# Altium schematic sheet P1.schdoc
size 594 x 419 mm; Device: Drawing-Symbol_A4; @Board Name: Board1_1; @Page Name: P1; @Create Time: 00:50:03; @Page Count: 1; @Page No: 1; @Schematic Name: Schematic1_1; @Update Time: 00:50:03; @Assembly Variant: Basic; Border: 1; Title Block Position: 3; Size: A4; Region Start: 1; X Region Count: 6; Y Region Count: 4; Blade Width: 10; Width: 2338; Height: 1652; Symbol: Drawing-Symbol_A4; Company: 嘉立创EDA; Version: V1.0; Page Size: A4; @Project Name: 基于F1C200S的Linux无线调试与AI协作网关; @Update Date: 2026-11-21; @Create Date: 2026-11-21
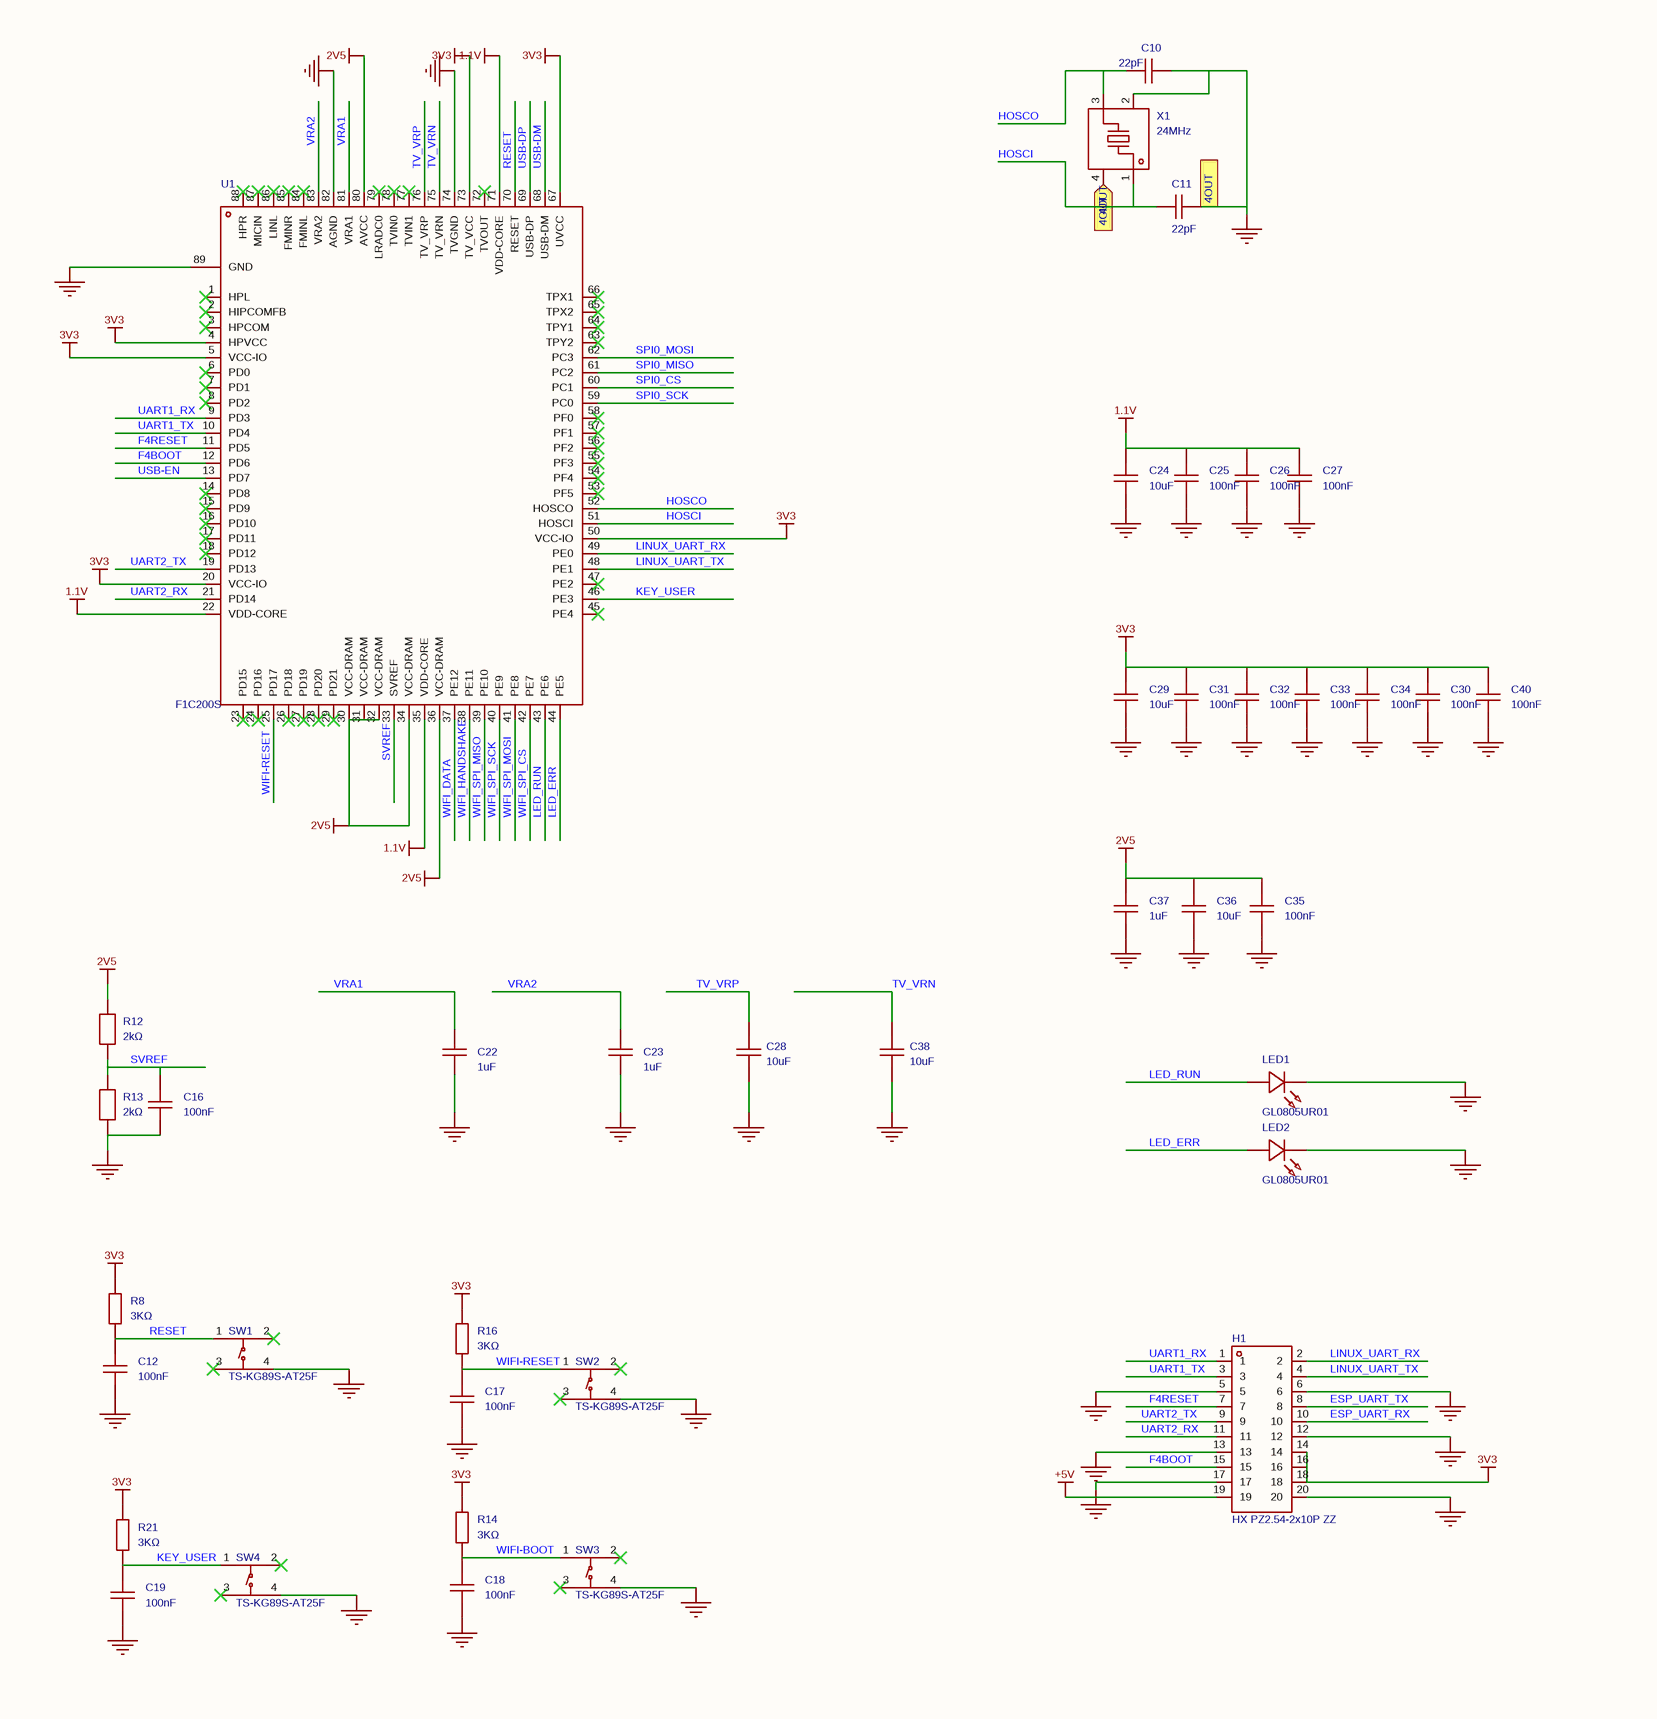
[diagram p0: P1.schdoc, left]
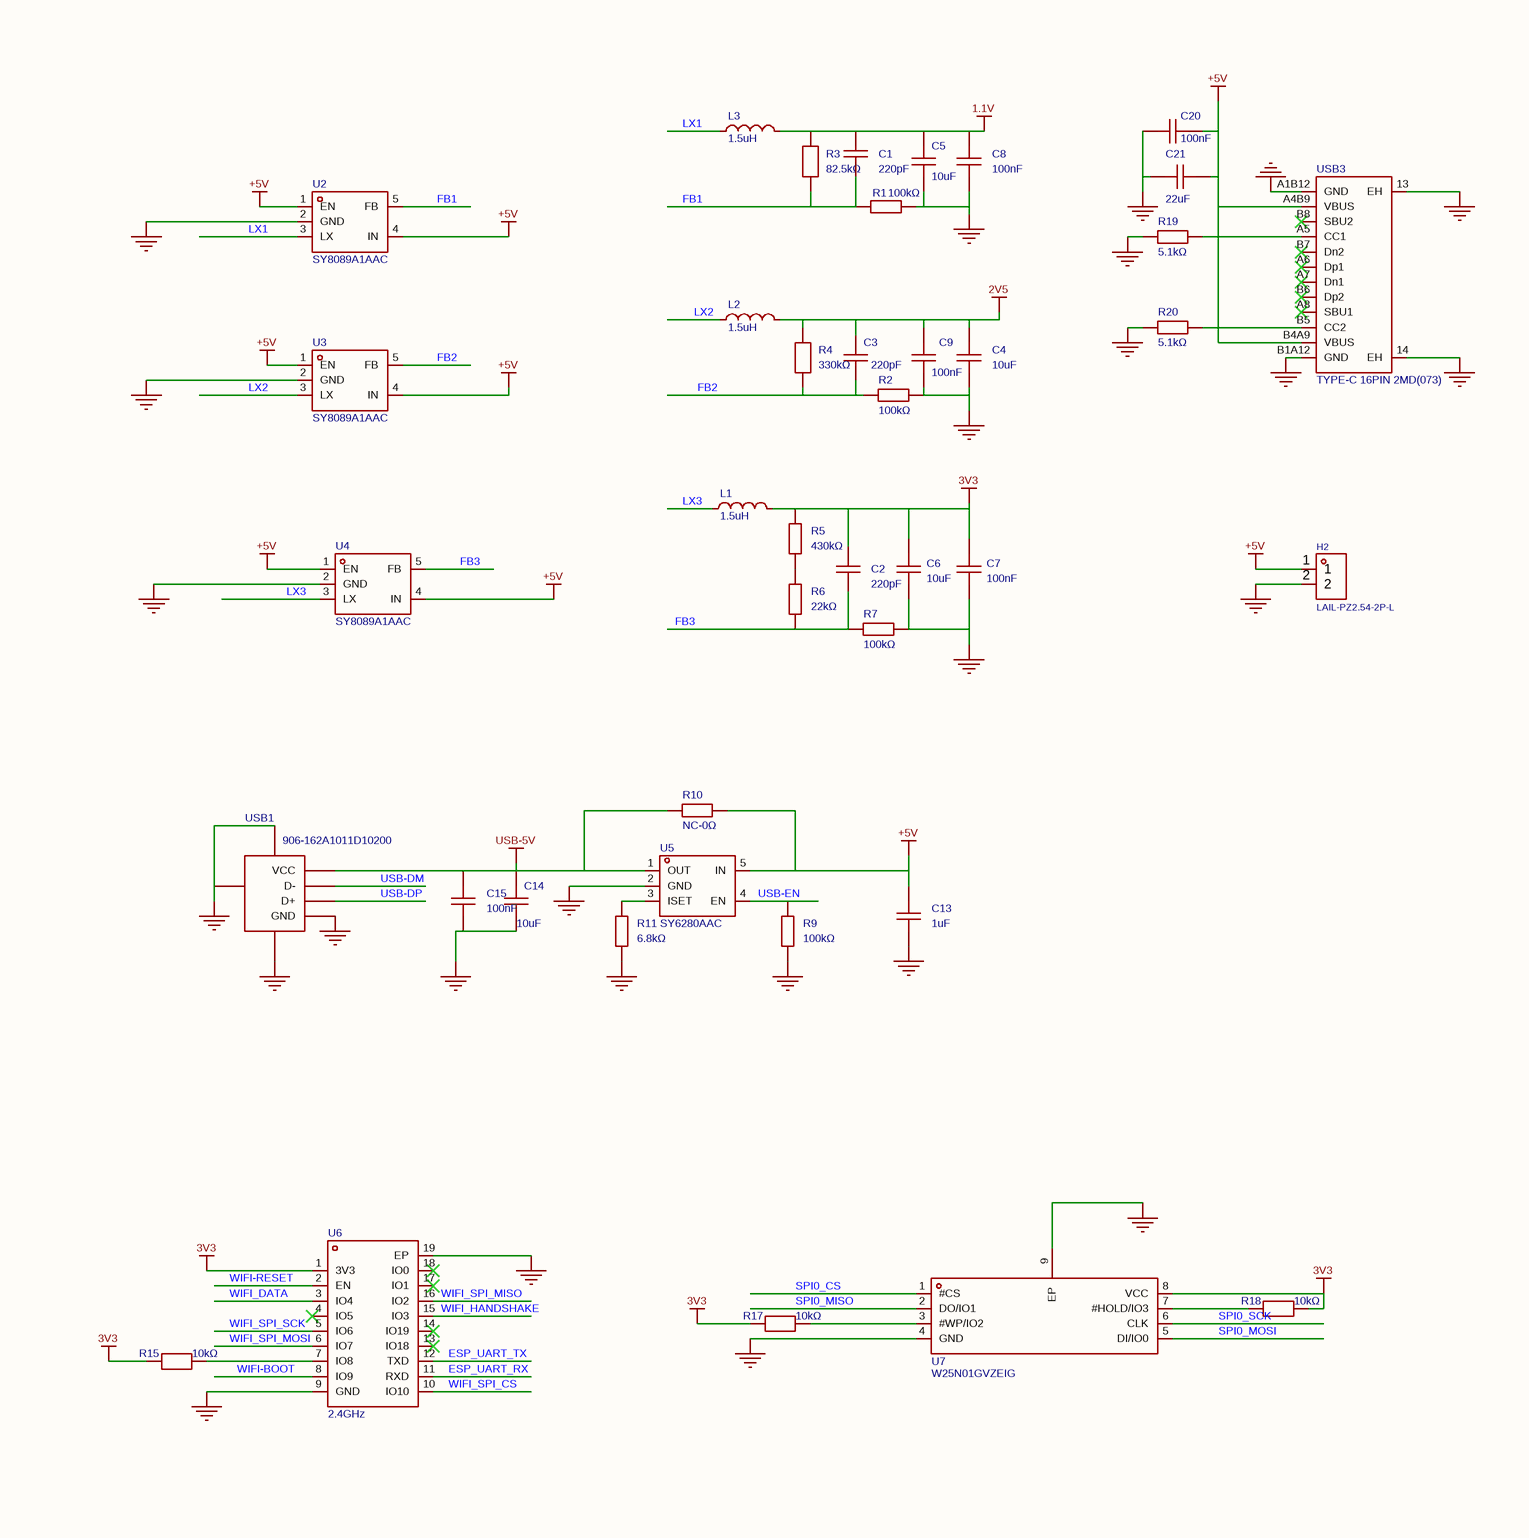
[diagram p1: P1.schdoc, right]

## Parts
C1  220pF  [C0603]
C2  220pF  [C0603]
C3  220pF  [C0603]
C4  10uF  [C0603]
C5  10uF  [C0603]
C6  10uF  [C0603]
C7  100nF  [C0603]
C8  100nF  [C0603]
C9  100nF  [C0603]
C10  22pF  [C0603]
C11  22pF  [C0603]
C12  100nF  [C0603]
C13  1uF  [C0402]
C14  10uF  [C0603]
C15  100nF  [C0603]
C16  100nF  [C0603]
C17  100nF  [C0603]
C18  100nF  [C0603]
C19  100nF  [C0603]
C20  100nF  [C0603]
C21  22uF  [C0603]
C22  1uF  [C0603]
C23  1uF  [C0603]
C24  10uF  [C0603]
C25  100nF  [C0603]
C26  100nF  [C0603]
C27  100nF  [C0603]
C28  10uF  [C0603]
C29  10uF  [C0603]
C30  100nF  [C0603]
C31  100nF  [C0603]
C32  100nF  [C0603]
C33  100nF  [C0603]
C34  100nF  [C0603]
C35  100nF  [C0603]
C36  10uF  [C0603]
C37  1uF  [C0603]
C38  10uF  [C0603]
C40  100nF  [C0603]
H1  HX PZ2.54-2x10P ZZ  [HDR-TH_20P-P2.54-V-M-R2-C10-S2.54]
H2  LAIL-PZ2.54-2P-L  [CONN-TH_LAIL-PZ2.54-2P-L]
L1  1.5uH  [L0805]
L2  1.5uH  [L0805]
L3  1.5uH  [L0805]
LED1  GL0805UR01  [LED0805-R-RD_RED]
LED2  GL0805UR01  [LED0805-R-RD_RED]
R1  100kΩ  [R0805]
R2  100kΩ  [R0805]
R3  82.5kΩ  [R0805]
R4  330kΩ  [R0805]
R5  430kΩ  [R0805]
R6  22kΩ  [R0805]
R7  100kΩ  [R0805]
R8  3KΩ  [R0805]
R9  100kΩ  [R0805]
R10  NC-0Ω  [R0805]
R11  6.8kΩ  [R0805]
R12  2kΩ  [R0805]
R13  2kΩ  [R0805]
R14  3KΩ  [R0805]
R15  10kΩ  [R0805]
R16  3KΩ  [R0805]
R17  10kΩ  [R0805]
R18  10kΩ  [R0805]
R19  5.1kΩ  [R0805]
R20  5.1kΩ  [R0805]
R21  3KΩ  [R0805]
SW1  TS-KG89S-AT25F  [SW-SMD_4P-L4.2-W3.3-P2.15-LS5.1]
SW2  TS-KG89S-AT25F  [SW-SMD_4P-L4.2-W3.3-P2.15-LS5.1]
SW3  TS-KG89S-AT25F  [SW-SMD_4P-L4.2-W3.3-P2.15-LS5.1]
SW4  TS-KG89S-AT25F  [SW-SMD_4P-L4.2-W3.3-P2.15-LS5.1]
U1  F1C200S  [QFN-88_L10.0-W10.0-P0.40-BL-EP6.75]
U2  SY8089A1AAC  [TSOT-23-5_L2.9-W1.6-P0.95-LS2.8-BR]
U3  SY8089A1AAC  [TSOT-23-5_L2.9-W1.6-P0.95-LS2.8-BR]
U4  SY8089A1AAC  [TSOT-23-5_L2.9-W1.6-P0.95-LS2.8-BR]
U5  SY6280AAC  [SOT-23-5_L3.0-W1.7-P0.95-LS2.8-BL]
U6  2.4GHz  [BULETM-SMD_ESPRESSIF_ESP32-C3-WROOM-02-N4-4MB]
U7  W25N01GVZEIG  [WSON-8_L8.0-W6.10-P1.27-TL-EP]
USB1  906-162A1011D10200  [USB-A-TH_4P-P1.40-V-F-C39416]
USB3  TYPE-C 16PIN 2MD(073)  [USB-C-SMD_TYPE-C-16PIN-2MD-073]
X1  24MHz  [CRYSTAL-SMD_4P-L3.2-W2.5-BL]

## Ports
4OUT (in)

## Nets
1.1V: C1.2 C5.1 C8.2 C24.2 C25.2 C26.2 C27.2 L3.2 R3.2 U1.22(VDD-CORE) U1.35(VDD-CORE) U1.71(VDD-CORE)
2V5: C3.2 C4.1 C9.2 C35.2 C36.2 C37.2 L2.2 R4.2 R12.2 U1.30(VCC-DRAM) U1.31(VCC-DRAM) U1.32(VCC-DRAM) U1.34(VCC-DRAM) U1.36(VCC-DRAM) U1.80(AVCC)
3V3: C2.2 C6.1 C7.2 C29.2 C30.2 C31.2 C32.2 C33.2 C34.2 C40.2 H1.14 H1.16 H1.18 L1.2 R5.2 R8.1 R14.1 R15.1 R16.1 R17.1 R18.2 R21.1 U1.4(HPVCC) U1.5(VCC-IO) U1.20(VCC-IO) U1.50(VCC-IO) U1.67(UVCC) U1.73(TV_VCC) U6.1(3V3) U7.8(VCC)
4OUT: C4.2 C5.2 C6.2 C7.1 C8.1 C9.1 C10.2 C11.2 C12.1 C13.1 C14.2 C15.2 C16.1 C17.1 C18.1 C19.1 C20.2 C21.2 C22.1 C23.1 C24.1 C25.1 C26.1 C27.1 C28.2 C29.1 C30.1 C31.1 C32.1 C33.1 C34.1 C35.1 C36.1 C37.1 C38.2 C40.1 H1.5 H1.6 H1.12 H1.13 H1.17 H1.20 H2.2 LED1.2(C) LED2.2(C) R1.1 R2.2 R7.2 R9.1 R11.1 R13.1 R19.1 R20.1 SW1.4 SW2.4 SW3.4 SW4.4 U1.74(TVGND) U1.82(AGND) U1.89(GND) U2.2(GND) U3.2(GND) U4.2(GND) U5.2(GND) U6.9(GND) U6.19(EP) U7.4(GND) U7.9(EP) USB1.4(GND) USB1.5 USB1.6 USB1.7 USB3.13(EH) USB3.14(EH) USB3.A1B12(GND) USB3.B1A12(GND) X1.2(GND) X1.4(GND) ; port 4OUT  [also labelled GND]
+5V: C13.2 C20.1 C21.1 H1.19 H2.1 R10.1 U2.1(EN) U2.4(IN) U3.1(EN) U3.4(IN) U4.1(EN) U4.4(IN) U5.5(IN) USB3.A4B9(VBUS) USB3.B4A9(VBUS)
USB-5V: C14.1 C15.1 R10.2 U5.1(OUT) USB1.1(VCC)
ESP_UART_RX: H1.10 U6.11(RXD)
ESP_UART_TX: H1.8 U6.12(TXD)
F4BOOT: H1.15 U1.12(PD6)
F4RESET: H1.7 U1.11(PD5)
FB1: C1.1 R1.2 R3.1 U2.5(FB)
FB2: C3.1 R2.1 R4.1 U3.5(FB)
FB3: C2.1 R6.1 R7.1 U4.5(FB)
HOSCI: C11.1 U1.51(HOSCI) X1.1
HOSCO: C10.1 U1.52(HOSCO) X1.3
KEY_USER: C19.2 R21.2 SW4.1 U1.46(PE3)
LED_ERR: LED2.1(A) U1.44(PE5)
LED_RUN: LED1.1(A) U1.43(PE6)
LINUX_UART_RX: H1.2 U1.49(PE0)
LINUX_UART_TX: H1.4 U1.48(PE1)
LX1: L3.1 U2.3(LX)
LX2: L2.1 U3.3(LX)
LX3: L1.1 U4.3(LX)
RESET: C12.2 R8.2 SW1.1 U1.70(RESET)
SPI0_CS: U1.60(PC1) U7.1(#CS)
SPI0_MISO: U1.61(PC2) U7.2(DO/IO1)
SPI0_MOSI: U1.62(PC3) U7.5(DI/IO0)
SPI0_SCK: U1.59(PC0) U7.6(CLK)
SVREF: C16.2 R12.1 R13.2 U1.33(SVREF)
TV_VRN: C38.1 U1.75(TV_VRN)
TV_VRP: C28.1 U1.76(TV_VRP)
UART1_RX: H1.1 U1.9(PD3)
UART1_TX: H1.3 U1.10(PD4)
UART2_RX: H1.11 U1.21(PD14)
UART2_TX: H1.9 U1.19(PD13)
USB-DM: U1.68(USB-DM) USB1.2(D-)
USB-DP: U1.69(USB-DP) USB1.3(D+)
USB-EN: R9.2 U1.13(PD7) U5.4(EN)
VRA1: C22.2 U1.81(VRA1)
VRA2: C23.2 U1.83(VRA2)
WIFI-BOOT: C18.2 R14.2 SW3.1 U6.8(IO9)
WIFI-RESET: C17.2 R16.2 SW2.1 U1.25(PD17) U6.2(EN)
WIFI_DATA: U1.37(PE12) U6.3(IO4)
WIFI_HANDSHAKE: U1.38(PE11) U6.15(IO3)
WIFI_SPI_CS: U1.42(PE7) U6.10(IO10)
WIFI_SPI_MISO: U1.39(PE10) U6.16(IO2)
WIFI_SPI_MOSI: U1.41(PE8) U6.6(IO7)
WIFI_SPI_SCK: U1.40(PE9) U6.5(IO6)
NetR5_1: R5.1 R6.2
NetR11_2: R11.2 U5.3(ISET)
NetR15_2: R15.2 U6.7(IO8)
NetR17_2: R17.2 U7.3(#WP/IO2)
NetR18_1: R18.1 U7.7(#HOLD/IO3)
NetR19_2: R19.2 USB3.A5(CC1)
NetR20_2: R20.2 USB3.B5(CC2)

Not connected (* = marked no-connect by the designer): SW1 2* 3*; SW2 2* 3*; SW3 2* 3*; SW4 2* 3*; U1 1(HPL)* 2(HIPCOMFB)* 3(HPCOM)* 6(PD0)* 7(PD1)* 8(PD2)* 14(PD8)* 15(PD9)* 16(PD10)* 17(PD11)* 18(PD12)* 23(PD15)* 24(PD16)* 26(PD18)* 27(PD19)* 28(PD20)* 29(PD21)* 45(PE4)* 47(PE2)* 53(PF5)* 54(PF4)* 55(PF3)* 56(PF2)* 57(PF1)* 58(PF0)* 63(TPY2)* 64(TPY1)* 65(TPX2)* 66(TPX1)* 72(TVOUT)* 77(TVIN1)* 78(TVIN0)* 79(LRADC0)* 84(FMINL)* 85(FMINR)* 86(LINL)* 87(MICIN)* 88(HPR)*; U6 4(IO5)* 13(IO18)* 14(IO19)* 17(IO1)* 18(IO0)*; USB3 A6(Dp1)* A7(Dn1)* A8(SBU1)* B6(Dp2)* B7(Dn2)* B8(SBU2)*

## Notes on the sheet
- 创建日期
- 2026-11-21
- 原理图
- 板子
- Schematic1_1
- Board1_1
- 更新日期
- 图页
- P1
- 绘制
- 审阅
- 基于F1C200S的Linux无线调试与AI协作网关
- 版本
- V1.0
- 尺寸
- A4
- 页    1    共    1
- 嘉立创EDA

## Library data of the parts
C1-C3 = CL10B221KB8NNNC: 容值:220pF;精度:±10%;额定电压:50V;温度系数:X7R;; Manufacturer: SAMSUNG(三星); 3D Model: ac125912035d415993ca9572d50418b1|0819f05c4eef4c71ace90d822a990e87; 3D Model Transform: 62.992,31.496,0,0,0,0,0,0,0; Tolerance: ±10%; Voltage Rating: 50V; Temperature Coefficient: X7R; AddInBom: yes; ModelName: C0603_L1.6-W0.8-H0.8; LCSC Part Name: 220pF ±10% 50V; Supplier Part: C1603; Manufacturer Part: CL10B221KB8NNNC; Supplier Footprint: 0603; JLCPCB Part Class: Basic Part; Datasheet: https://item.szlcsc.com/datasheet/CL10B221KB8NNNC/1955.html; Supplier: LCSC; Value: 220pF; Symbol: CL10B221KB8NNNC; Device: CL10B221KB8NNNC; ConvertToPcb: yes; FootprintName: C0603
C4-C6 C14 C24 C28 C29 C36 C38 = CL10A106KP8NNNC: 容值:10uF;精度:±10%;额定电压:10V;温度系数:X5R;; Manufacturer: SAMSUNG(三星); 3D Model: ac125912035d415993ca9572d50418b1|0819f05c4eef4c71ace90d822a990e87; 3D Model Transform: 62.992,31.496,0,0,0,0,0,0,0; Tolerance: ±10%; Voltage Rating: 10V; Temperature Coefficient: X5R; AddInBom: yes; ModelName: C0603_L1.6-W0.8-H0.8; LCSC Part Name: 10uF ±10% 10V; Supplier Part: C19702; Manufacturer Part: CL10A106KP8NNNC; Supplier Footprint: 0603; JLCPCB Part Class: Basic Part; Datasheet: https://item.szlcsc.com/datasheet/CL10A106KP8NNNC/20411.html; Supplier: LCSC; Value: 10uF; Symbol: CL10A106KP8NNNC; Device: CL10A106KP8NNNC; ConvertToPcb: yes; FootprintName: C0603
C7-C9 C15 C20 = CGA0603X7R104K500JT: 容值:100nF;精度:±10%;额定电压:50V;温度系数:X7R;; Manufacturer: HRE(芯声); 3D Model: ac125912035d415993ca9572d50418b1|0819f05c4eef4c71ace90d822a990e87; 3D Model Transform: 62.992,31.496,0,0,0,0,0,0,0; Tolerance: ±10%; Voltage Rating: 50V; Temperature Coefficient: X7R; AddInBom: yes; ModelName: C0603_L1.6-W0.8-H0.8; LCSC Part Name: 100nF ±10% 50V; Supplier Part: C6119867; Manufacturer Part: CGA0603X7R104K500JT; Supplier Footprint: 0603; JLCPCB Part Class: Extended Part; Datasheet: https://item.szlcsc.com/datasheet/CGA0603X7R104K500JT/7062573.html; Supplier: LCSC; Value: 100nF; Symbol: CGA0603X7R104K500JT; Device: CGA0603X7R104K500JT; ConvertToPcb: yes; FootprintName: C0603
C10 C11 = CL10C220JB8NNNC: 容值:22pF;精度:±5%;额定电压:50V;温度系数:C0G;; Manufacturer: SAMSUNG(三星); 3D Model: ac125912035d415993ca9572d50418b1|0819f05c4eef4c71ace90d822a990e87; 3D Model Transform: 62.992,31.496,0,0,0,0,0,0,0; Tolerance: ±5%; Voltage Rating: 50V; Temperature Coefficient: C0G; AddInBom: yes; ModelName: C0603_L1.6-W0.8-H0.8; LCSC Part Name: 22pF ±5% 50V; Supplier Part: C1653; Manufacturer Part: CL10C220JB8NNNC; Supplier Footprint: 0603; JLCPCB Part Class: Basic Part; Datasheet: https://item.szlcsc.com/datasheet/CL10C220JB8NNNC/2005.html; Supplier: LCSC; Value: 22pF; Symbol: CL10C220JB8NNNC; Device: CL10C220JB8NNNC; ConvertToPcb: yes; FootprintName: C0603
C12 C17-C19 C25-C27 C30-C35 C40 = CC0603KRX7R9BB104: 容值:100nF;精度:±10%;额定电压:50V;温度系数:X7R;; Manufacturer: YAGEO(国巨); 3D Model: ac125912035d415993ca9572d50418b1|0819f05c4eef4c71ace90d822a990e87; 3D Model Transform: 62.992,31.496,0,0,0,0,0,0,0; Tolerance: ±10%; Voltage Rating: 50V; Temperature Coefficient: X7R; AddInBom: yes; ModelName: C0603_L1.6-W0.8-H0.8; LCSC Part Name: 100nF ±10% 50V; Supplier Part: C14663; Manufacturer Part: CC0603KRX7R9BB104; Supplier Footprint: 0603; JLCPCB Part Class: Basic Part; Datasheet: https://item.szlcsc.com/datasheet/CC0603KRX7R9BB104/15331.html; Supplier: LCSC; Value: 100nF; Symbol: CC0603KRX7R9BB104; Device: CC0603KRX7R9BB104; ConvertToPcb: yes; FootprintName: C0603
C13 = HGC0402R5105K500NTEJ: 容值:1uF;精度:±10%;额定电压:50V;温度系数:X5R;; Manufacturer: Chinocera(华瓷); 3D Model: 36a51122f27c49738f86b3bfa98863e0|0819f05c4eef4c71ace90d822a990e87; 3D Model Transform: 39.37,19.685,0,0,0,0,0,0,0; Tolerance: ±10%; Voltage Rating: 50V; Temperature Coefficient: X5R; AddInBom: yes; ModelName: C0402_L1.0-W0.5-H0.5; LCSC Part Name: 1uF ±10% 50V; Supplier Part: C7472948; Manufacturer Part: HGC0402R5105K500NTEJ; Supplier Footprint: 0402; JLCPCB Part Class: Extended Part; Datasheet: https://item.szlcsc.com/datasheet/HGC0402R5105K500NTEJ/8532795.html; Supplier: LCSC; Value: 1uF; Symbol: HGC0402R5105K500NTEJ; Device: HGC0402R5105K500NTEJ; ConvertToPcb: yes; FootprintName: C0402
C16 = FCC0603B104K500CT: 容值:100nF;精度:±10%;额定电压:50V;温度系数:X7R;; Manufacturer: FOJAN(富捷); AddInBom: yes; ModelId: ac125912035d415993ca9572d50418b1|0819f05c4eef4c71ace90d822a990e87; ModelName: C0603_L1.6-W0.8-H0.8; ModelTransform: 62.992,31.496,0,0,0,0,0,0,0; Tolerance: ±10%; Voltage Rating: 50V; Temperature Coefficient: X7R; Symbol: FCC0603B104K500CT; Device: FCC0603B104K500CT; LCSC Part Name: 100nF ±10% 50V; SupplierPart: C5137636; ManufacturerPart: FCC0603B104K500CT; Supplier Footprint: 0603; JLCPCB Part Class: Extended Part; Datasheet: https://item.szlcsc.com/datasheet/FCC0603B104K500CT/5747088.html; Supplier: LCSC; ConvertToPcb: yes; FootprintName: C0603; Value: 100nF; Operating Temperature: -55℃~+125℃
C21 = HGC0603R5226M100NTHJ: 容值:22uF;精度:±20%;额定电压:10V;温度系数:X5R;; Manufacturer: Chinocera(华瓷); 3D Model: ac125912035d415993ca9572d50418b1|0819f05c4eef4c71ace90d822a990e87; 3D Model Transform: 62.992,31.496,0,0,0,0,0,0,0; Tolerance: ±20%; Voltage Rating: 10V; Temperature Coefficient: X5R; AddInBom: yes; ModelName: C0603_L1.6-W0.8-H0.8; LCSC Part Name: 22uF ±20% 10V; Supplier Part: C7432770; Manufacturer Part: HGC0603R5226M100NTHJ; Supplier Footprint: 0603; JLCPCB Part Class: Extended Part; Datasheet: https://item.szlcsc.com/datasheet/HGC0603R5226M100NTHJ/8438252.html; Supplier: LCSC; Value: 22uF; Symbol: HGC0603R5226M100NTHJ; Device: HGC0603R5226M100NTHJ; ConvertToPcb: yes; FootprintName: C0603
C22 C23 = CL10A105KO8NNNC: 容值:1uF;精度:±10%;额定电压:16V;温度系数:X5R;; Manufacturer: SAMSUNG(三星); AddInBom: yes; ModelId: ac125912035d415993ca9572d50418b1|0819f05c4eef4c71ace90d822a990e87; ModelName: C0603_L1.6-W0.8-H0.8; ModelTransform: 62.992,31.496,0,0,0,0,0,0,0; Tolerance: ±10%; Voltage Rating: 16V; Temperature Coefficient: X5R; Symbol: CL10A105KO8NNNC; Device: CL10A105KO8NNNC; LCSC Part Name: 1uF ±10% 16V; SupplierPart: C1592; ManufacturerPart: CL10A105KO8NNNC; Supplier Footprint: 0603; JLCPCB Part Class: Extended Part; Datasheet: https://item.szlcsc.com/datasheet/CL10A105KO8NNNC/1944.html; Supplier: LCSC; ConvertToPcb: yes; FootprintName: C0603; Value: 1uF
C37 = CL10A105KB8NNNC: 容值:1uF;精度:±10%;额定电压:50V;温度系数:X5R;; Manufacturer: SAMSUNG(三星); 3D Model: ac125912035d415993ca9572d50418b1|0819f05c4eef4c71ace90d822a990e87; 3D Model Transform: 62.992,31.496,0,0,0,0,0,0,0; Tolerance: ±10%; Voltage Rating: 50V; Temperature Coefficient: X5R; AddInBom: yes; ModelName: C0603_L1.6-W0.8-H0.8; LCSC Part Name: 1uF ±10% 50V; Supplier Part: C15849; Manufacturer Part: CL10A105KB8NNNC; Supplier Footprint: 0603; JLCPCB Part Class: Basic Part; Datasheet: https://item.szlcsc.com/datasheet/CL10A105KB8NNNC/16531.html; Supplier: LCSC; Value: 1uF; Symbol: CL10A105KB8NNNC; Device: CL10A105KB8NNNC; ConvertToPcb: yes; FootprintName: C0603
H1 = HX PZ2.54-2x10P ZZ: 插针结构:2x10P;间距:2.54mm;行距:2.54mm;圆针/方针:方针;安装方式:直插;排数:双排;总PIN位数:20P;额定电流:3A;额定电压:1kV;配合针长度:6mm;塑高:2.5mm;端接针长度:3mm;触头材质:铜合金;触头镀层:金;工作温度:-40℃~+105℃;颜色:黑色;; Manufacturer: hanxia(韩下); AddInBom: yes; ModelId: 4db18abb801146cba4d3ccb6f1ee36cf|0819f05c4eef4c71ace90d822a990e87; ModelName: HDR-TH_20P-P2.54-V-M-R2-C10-S2.54-1; ModelTransform: 1000.3917,199.9996,0,0,0,0,0,0,-118.11; Pin Structure: 2x10P; Pitch: 2.54mm; Circluar Pins/Square Pins: 方针; Current Rating: 3A; Voltage Rating (Max): 1kV; Symbol: HX PZ2.54-2X10P ZZ; Device: HX PZ2.54-2x10P ZZ; LCSC Part Name: 2x10P 间距:2.54mm 方针 直插; SupplierPart: C42372518; ManufacturerPart: HX PZ2.54-2x10P ZZ; Supplier Footprint: 插件,P=2.54mm; JLCPCB Part Class: Extended Part; Datasheet: https://item.szlcsc.com/datasheet/HX%2520PZ2.54-2x10P%2520ZZ/44255759.html; Supplier: LCSC; ConvertToPcb: yes; FootprintName: HDR-TH_20P-P2.54-V-M-R2-C10-S2.54; Row Spacing: 2.54mm; Mounting Type: 直插; Number of Rows: 双排; Number of Pins: 20P; Length of Mating Pin: 6mm; Insulation Height: 2.5mm; Length of End Connection Pin: 3mm; Contact Material: 铜合金; Contact Plating: 金; Operating Temperature: -40℃~+105℃; Color: 黑色; Supplementary Features: -
H2 = LAIL-PZ2.54-2P-L: 插针结构:1x2P;间距:2.54mm;圆针/方针:方针;安装方式:直插;排数:单排;总PIN位数:2P;额定电流:3A;额定电压:250V;配合针长度:6mm;塑高:2.5mm;端接针长度:3mm;触头材质:黄铜;触头镀层:金;工作温度:-25℃~+80℃;颜色:黑色;; Manufacturer: LAILAN(莱联); AddInBom: yes; ModelId: 901d3cbfa642481a93eac4cb0da62289|0819f05c4eef4c71ace90d822a990e87; ModelName: HDR-TH_LAIL-PZ2.54-2P-L; ModelTransform: 200.03897,98.425,0,0,0,0,0,0,-118.11; Pin Structure: 1x2P; Pitch: 2.54mm; Circluar Pins/Square Pins: 方针; Current Rating: 3A; Voltage Rating (Max): 250V; Symbol: LAIL-PZ2.54-2P-L; Device: LAIL-PZ2.54-2P-L; LCSC Part Name: 1x2P 间距:2.54mm 方针 直插; SupplierPart: C54950603; ManufacturerPart: LAIL-PZ2.54-2P-L; Supplier Footprint: 插件,P=2.54mm; JLCPCB Part Class: Extended Part; Datasheet: https://item.szlcsc.com/datasheet/LAIL-PZ2.54-2P-L/58519956.html; Supplier: LCSC; ConvertToPcb: yes; FootprintName: CONN-TH_LAIL-PZ2.54-2P-L; Mounting Type: 直插; Number of Rows: 单排; Number of Pins: 2P; Length of Mating Pin: 6mm; Insulation Height: 2.5mm; Length of End Connection Pin: 3mm; Contact Material: 黄铜; Contact Plating: 金; Operating Temperature: -25℃~+80℃; Color: 黑色
L1-L3 = DFE201210U-1R5M=P2: 电感值:1.5uH;精度:±20%;额定电流:1.6A;饱和电流(Isat):2.5A;; Manufacturer: muRata(村田); AddInBom: yes; ModelId: 37a81e68749a4138bd2dfa6897b24b85|0819f05c4eef4c71ace90d822a990e87; ModelName: R0805_L2.0-W1.3-H0.6; ModelTransform: 78.74,51.181,0,0,0,0,0,0.001,0; Tolerance: ±20%; Current Rating: 1.6A; Current - Saturation(Isat): 2.5A; DC Resistance(DCR): 138mΩ; Symbol: DFE201210U-1R5M=P2; Device: DFE201210U-1R5M=P2; LCSC Part Name: 1.5uH ±20% 2.5A; SupplierPart: C2891571; ManufacturerPart: DFE201210U-1R5M=P2; Supplier Footprint: 0805; JLCPCB Part Class: Extended Part; Datasheet: https://item.szlcsc.com/datasheet/DFE201210U-1R5M%253DP2/3118954.html; Supplier: LCSC; ConvertToPcb: yes; FootprintName: L0805; Value: 1.5uH; Ratings: -
LED1 LED2 = GL0805UR01: 灯头类型:2mmx1.25mm方形灯头;发光颜色:红色;正向压降(Vf):1.8V~2.1V;功率:-;测试电流:20mA;波长:620nm~625nm;二极管配置:独立二极管;透镜颜色:无色透明透镜;色温:-;发光强度:80mcd~100mcd;发光角度:120°;载带方式:正贴;工作温度:-40℃~+85℃;; Manufacturer: Guiguang light(桂光光电); AddInBom: yes; ModelId: f010e90d36544999ab4e363fdba5b490|0819f05c4eef4c71ace90d822a990e87; ModelTransform: 78.74,49.21644,0,0,0,0,0,0,0; Illumination Color: 红色; Test Current: 20mA; Diode Configuration: 独立二极管; Lens Color: 无色透明透镜; Viewing Angle: 120°; Symbol: GL0805UR01; Device: GL0805UR01; LCSC Part Name: 0805 红灯 高亮; SupplierPart: C51933307; ManufacturerPart: GL0805UR01; Supplier Footprint: 0805; JLCPCB Part Class: Extended Part; Datasheet: https://item.szlcsc.com/datasheet/GL0805UR01/54646003.html; Supplier: LCSC; ConvertToPcb: yes; FootprintName: LED0805-R-RD_RED; ModelName: LED0805-R-RD_RED; Lamp Holder Type: 2mmx1.25mm方形灯头; Voltage - Forward(Vf): 1.8V~2.1V; Power(Watts): -; Wavelength - Dominant: 620nm~625nm; Peak Wavelength: -; Color Temperature: -; Luminous Intensity: 80mcd~100mcd; Mounting Style: 正贴; Operating Temperature: -40℃~+85℃
R1 R2 R7 R9 R10 = 0805W8F1003T5E: 电阻类型:厚膜电阻;阻值:100kΩ;精度:±1%;功率:125mW;工作电压:150V;温度系数:±100ppm/℃;; Manufacturer: UNI-ROYAL(厚声); 3D Model: 37a81e68749a4138bd2dfa6897b24b85|0819f05c4eef4c71ace90d822a990e87; 3D Model Transform: 78.74,51.181,0,0,0,0,0,-0.0005,0; Tolerance: ±1%; Power(Watts): 125mW; Voltage-Supply(Max): 150V; Symbol: 0805W8F1003T5E_C149504; AddInBom: yes; ModelName: R0805_L2.0-W1.3-H0.6; LCSC Part Name: 100kΩ ±1% 125mW 厚膜电阻; Manufacturer Part: 0805W8F1003T5E; Supplier Footprint: 0805; JLCPCB Part Class: Basic Part; Datasheet: https://item.szlcsc.com/datasheet/0805W8F1003T5E/160838.html; Supplier: LCSC; Type: 厚膜电阻; Temperature Coefficient: ±100ppm/℃; Operating Temperature: -55℃~+155℃; Device: 0805W8F1003T5E; ConvertToPcb: yes; FootprintName: R0805
  R1 R2 R7 R9: Supplier Part: C149504; Value: 100kΩ
  R10: Value: NC-0Ω
R3 = FRC0805F8252TS: 电阻类型:厚膜电阻;阻值:82.5kΩ;精度:±1%;功率:125mW;工作电压:150V;温度系数:±100ppm/℃;; Manufacturer: FOJAN(富捷); AddInBom: yes; ModelId: 37a81e68749a4138bd2dfa6897b24b85|0819f05c4eef4c71ace90d822a990e87; ModelName: R0805_L2.0-W1.3-H0.6; ModelTransform: 78.74,51.181,0,0,0,0,0,-0.0005,0; Tolerance: ±1%; Power(Watts): 125mW; Voltage-Supply(Max): 150V; Symbol: FRC0805F8252TS; Device: FRC0805F8252TS; LCSC Part Name: 82.5kΩ ±1% 125mW 厚膜电阻; SupplierPart: C3013228; ManufacturerPart: FRC0805F8252TS; Supplier Footprint: 0805; JLCPCB Part Class: Extended Part; Supplier: LCSC; ConvertToPcb: yes; FootprintName: R0805; Type: 厚膜电阻; Value: 82.5kΩ; Temperature Coefficient: ±100ppm/℃; Operating Temperature: -55℃~+155℃
R4 = FRC0805F3303TS: 电阻类型:厚膜电阻;阻值:330kΩ;精度:±1%;功率:125mW;工作电压:150V;温度系数:±100ppm/℃;; Manufacturer: FOJAN(富捷); AddInBom: yes; ModelId: 37a81e68749a4138bd2dfa6897b24b85|0819f05c4eef4c71ace90d822a990e87; ModelName: R0805_L2.0-W1.3-H0.6; ModelTransform: 78.74,51.181,0,0,0,0,0,-0.0005,0; Tolerance: ±1%; Power(Watts): 125mW; Voltage-Supply(Max): 150V; Symbol: FRC0805F3303TS; Device: FRC0805F3303TS; LCSC Part Name: 330kΩ ±1% 125mW 厚膜电阻; SupplierPart: C2907257; ManufacturerPart: FRC0805F3303TS; Supplier Footprint: 0805; JLCPCB Part Class: Extended Part; Datasheet: https://item.szlcsc.com/datasheet/FRC0805F3303TS/3180770.html; Supplier: LCSC; ConvertToPcb: yes; FootprintName: R0805; Type: 厚膜电阻; Value: 330kΩ; Temperature Coefficient: ±100ppm/℃; Operating Temperature: -55℃~+155℃
R5 = PTFR0805B430KN9: 电阻类型:薄膜电阻;阻值:430kΩ;精度:±0.1%;功率:130mW;工作电压:150V;温度系数:±10ppm/℃;; Manufacturer: RESI(开步睿思); 3D Model: 37a81e68749a4138bd2dfa6897b24b85|0819f05c4eef4c71ace90d822a990e87; 3D Model Transform: 78.74,51.181,0,0,0,0,0,-0.0005,0; Tolerance: ±0.1%; Power(Watts): 130mW; Voltage-Supply(Max): 150V; AddInBom: yes; ModelName: R0805_L2.0-W1.3-H0.6; LCSC Part Name: 薄膜电阻 430kΩ ±0.1% 130mW; Supplier Part: C351566; Manufacturer Part: PTFR0805B430KN9; Supplier Footprint: 0805; JLCPCB Part Class: Extended Part; Datasheet: https://item.szlcsc.com/datasheet/PTFR0805B430KN9/327474.html; Supplier: LCSC; Type: 薄膜电阻; Value: 430kΩ; Temperature Coefficient: ±10ppm/℃; Operating Temperature: -55℃~+125℃; Symbol: PTFR0805B430KN9; Device: PTFR0805B430KN9; ConvertToPcb: yes; FootprintName: R0805
R6 = 0805W8F2202T5E: 电阻类型:厚膜电阻;阻值:22kΩ;精度:±1%;功率:125mW;工作电压:150V;温度系数:±100ppm/℃;; Manufacturer: UNI-ROYAL(厚声); 3D Model: 37a81e68749a4138bd2dfa6897b24b85|0819f05c4eef4c71ace90d822a990e87; 3D Model Transform: 78.74,51.181,0,0,0,0,0,-0.0005,0; Tolerance: ±1%; Power(Watts): 125mW; Voltage-Supply(Max): 150V; AddInBom: yes; ModelName: R0805_L2.0-W1.3-H0.6; LCSC Part Name: 22kΩ ±1% 125mW 厚膜电阻; Supplier Part: C17560; Manufacturer Part: 0805W8F2202T5E; Supplier Footprint: 0805; JLCPCB Part Class: Basic Part; Datasheet: https://item.szlcsc.com/datasheet/0805W8F2202T5E/18248.html; Supplier: LCSC; Type: 厚膜电阻; Value: 22kΩ; Temperature Coefficient: ±100ppm/℃; Operating Temperature: -55℃~+155℃; Symbol: 0805W8F2202T5E; Device: 0805W8F2202T5E; ConvertToPcb: yes; FootprintName: R0805
R8 R14 R16 R21 = 0805W8F1002T5E_C17414: 电阻类型:厚膜电阻;阻值:10kΩ;精度:±1%;功率:125mW;工作电压:150V;温度系数:±100ppm/℃;; Manufacturer: UNI-ROYAL(厚声); Add into BOM: yes; 3D Model: 37a81e68749a4138bd2dfa6897b24b85; 3D Model Transform: 78.74,51.181,0,0,0,0,0,-0.0005,0; Tolerance: ±1%; Power(Watts): 125mW; Voltage-Supply(Max): 150V; ModelName: R0805_L2.0-W1.3-H0.6; Convert to PCB: yes; Supplier Footprint: 0805; Value: 3KΩ; LCSC Part Name: 10kΩ ±1% 125mW 厚膜电阻; Manufacturer Part: 0805W8F1002T5E; JLCPCB Part Class: Basic Part; Datasheet: https://item.szlcsc.com/datasheet/0805W8F1002T5E/18102.html; Supplier: LCSC; Type: 厚膜电阻; Temperature Coefficient: ±100ppm/℃; Operating Temperature: -55℃~+155℃; Symbol: 0805W8F1002T5E; Device: 0805W8F1002T5E_C17414; FootprintName: R0805
R11 = 0805W8F6801T5E: 电阻类型:厚膜电阻;阻值:6.8kΩ;精度:±1%;功率:125mW;工作电压:150V;温度系数:±100ppm/℃;; Manufacturer: UNI-ROYAL(厚声); 3D Model: 37a81e68749a4138bd2dfa6897b24b85|0819f05c4eef4c71ace90d822a990e87; 3D Model Transform: 78.74,51.181,0,0,0,0,0,-0.0005,0; Tolerance: ±1%; Power(Watts): 125mW; Voltage-Supply(Max): 150V; AddInBom: yes; ModelName: R0805_L2.0-W1.3-H0.6; LCSC Part Name: 6.8kΩ ±1% 125mW 厚膜电阻; Supplier Part: C17772; Manufacturer Part: 0805W8F6801T5E; Supplier Footprint: 0805; JLCPCB Part Class: Basic Part; Datasheet: https://item.szlcsc.com/datasheet/0805W8F6801T5E/18460.html; Supplier: LCSC; Type: 厚膜电阻; Value: 6.8kΩ; Temperature Coefficient: ±100ppm/℃; Operating Temperature: -55℃~+155℃; Symbol: 0805W8F6801T5E; Device: 0805W8F6801T5E; ConvertToPcb: yes; FootprintName: R0805
R12 R13 = FRC0805F2001TS: 电阻类型:厚膜电阻;阻值:2kΩ;精度:±1%;功率:125mW;工作电压:150V;温度系数:±100ppm/℃;; Manufacturer: FOJAN(富捷); AddInBom: yes; ModelId: 37a81e68749a4138bd2dfa6897b24b85|0819f05c4eef4c71ace90d822a990e87; ModelName: R0805_L2.0-W1.3-H0.6; ModelTransform: 78.74,51.181,0,0,0,0,0,-0.0005,0; Tolerance: ±1%; Power(Watts): 125mW; Voltage-Supply(Max): 150V; Symbol: FRC0805F2001TS; Device: FRC0805F2001TS; LCSC Part Name: 2kΩ ±1% 125mW 厚膜电阻; SupplierPart: C2907248; ManufacturerPart: FRC0805F2001TS; Supplier Footprint: 0805; JLCPCB Part Class: Extended Part; Supplier: LCSC; ConvertToPcb: yes; FootprintName: R0805; Type: 厚膜电阻; Value: 2kΩ; Temperature Coefficient: ±100ppm/℃; Operating Temperature: -55℃~+155℃
R15 R17 R18 = FRC0805F1002TS: 电阻类型:厚膜电阻;阻值:10kΩ;精度:±1%;功率:125mW;工作电压:150V;温度系数:±100ppm/℃;; Manufacturer: FOJAN(富捷); AddInBom: yes; ModelId: 37a81e68749a4138bd2dfa6897b24b85|0819f05c4eef4c71ace90d822a990e87; ModelName: R0805_L2.0-W1.3-H0.6; ModelTransform: 78.74,51.181,0,0,0,0,0,-0.0005,0; Tolerance: ±1%; Power(Watts): 125mW; Voltage-Supply(Max): 150V; Symbol: FRC0805F1002TS; Device: FRC0805F1002TS; LCSC Part Name: 10kΩ ±1% 125mW 厚膜电阻; SupplierPart: C2907219; ManufacturerPart: FRC0805F1002TS; Supplier Footprint: 0805; JLCPCB Part Class: Extended Part; Supplier: LCSC; ConvertToPcb: yes; FootprintName: R0805; Type: 厚膜电阻; Value: 10kΩ; Temperature Coefficient: ±100ppm/℃; Operating Temperature: -55℃~+155℃
R19 R20 = 0805W8F5101T5E: 电阻类型:厚膜电阻;阻值:5.1kΩ;精度:±1%;功率:125mW;工作电压:150V;温度系数:±100ppm/℃;; Manufacturer: UNI-ROYAL(厚声); 3D Model: 37a81e68749a4138bd2dfa6897b24b85|0819f05c4eef4c71ace90d822a990e87; 3D Model Transform: 78.74,51.181,0,0,0,0,0,-0.0005,0; Tolerance: ±1%; Power(Watts): 125mW; Voltage-Supply(Max): 150V; AddInBom: yes; ModelName: R0805_L2.0-W1.3-H0.6; LCSC Part Name: 5.1kΩ ±1% 125mW 厚膜电阻; Supplier Part: C27834; Manufacturer Part: 0805W8F5101T5E; Supplier Footprint: 0805; JLCPCB Part Class: Basic Part; Datasheet: https://item.szlcsc.com/datasheet/0805W8F5101T5E/28584.html; Supplier: LCSC; Type: 厚膜电阻; Value: 5.1kΩ; Temperature Coefficient: ±100ppm/℃; Operating Temperature: -55℃~+155℃; Symbol: 0805W8F5101T5E; Device: 0805W8F5101T5E; ConvertToPcb: yes; FootprintName: R0805
SW1-SW4 = TS-KG89S-AT25F: 电路结构:单刀单掷;按钮形状:椭圆形按钮;作用力:250gf;安装方式:立贴;开关长度:4.2mm;开关宽度:3.25mm;开关高度:2.5mm;带支架:不带;触点电流:50mA;额定电压(DC):12V;绝缘电阻:100MΩ;机械寿命:10万次;; Manufacturer: HANBO(汉博); 3D Model: 101da67941e24d4e9615179a94fc6132|0819f05c4eef4c71ace90d822a990e87; 3D Model Transform: 204.724,127.9525,0,0,0,0,0,0,0; Circuit: 单刀单掷; Actuator Style: 椭圆形按钮; Operating Force: 250gf; Switch Length: 4.2mm; Switch Width: 3.25mm; Switch Height: 2.5mm; Strike Gundam: 不带; Contact Current: 50mA; Voltage Rating (DC): 12V; Insulation Resistance: 100MΩ; Actuator/Cap Color: 白色; Pin Style: SMD接片; Mechanical Life: 10万次; AddInBom: yes; ModelName: SW-SMD_4P-L4.2-W3.3-H2.5-P2.15-LS5.1; LCSC Part Name: 4.2*3.25*2.5mm 立贴 轻触开关; Supplier Part: C2874599; Manufacturer Part: TS-KG89S-AT25F; Supplier Footprint: SMD; JLCPCB Part Class: Extended Part; Datasheet: https://atta.szlcsc.com/upload/public/pdf/source/20221110/0D75E68DCC1CEC2670E8A2B9A9134A65.pdf; Supplier: LCSC; Mounting Style: 立贴; Symbol: TS-KG89S-AT25F; Device: TS-KG89S-AT25F; ConvertToPcb: yes; FootprintName: SW-SMD_4P-L4.2-W3.3-P2.15-LS5.1
U1 = F1C200S: CPU内核:其他;CPU位数:32 Bit;; Manufacturer: Allwinner(全志); AddInBom: yes; ModelId: 9fbb6eebc76e44f2957bc86852556e57|0819f05c4eef4c71ace90d822a990e87; ModelName: QFN-88_L10.0-W10.0-H0.8-P0.40-BL-EP; ModelTransform: 393.7,393.7,0,0,0,0,0,0,0; CPU Core: 其他; Core Size: 32 Bit; Program Memory Type: 外接; ADC (Bit): 6bit；12bit; Oscillator Type: 外置; Symbol: F1C200S; Device: F1C200S; LCSC Part Name: Allwinner F1C200S; SupplierPart: C2879851; ManufacturerPart: F1C200S; Supplier Footprint: QFN-88-EP(10x10); JLCPCB Part Class: Extended Part; Datasheet: https://item.szlcsc.com/datasheet/F1C200S/3089073.html; Supplier: LCSC; ConvertToPcb: yes; FootprintName: QFN-88_L10.0-W10.0-P0.40-BL-EP6.75; Operating Temperature: -20℃~+85℃
U2-U4 = SY8089A1AAC: 功能类型:降压型;工作电压:2.5V~5.5V;输出电压:-;输出电流:2A;输出类型:可调;; Manufacturer: Silergy(矽力杰); 3D Model: b5108020abe84f7bb0f3c398b43b6e0b|0819f05c4eef4c71ace90d822a990e87; 3D Model Transform: 110.45568,114.173,0,180,0,0,0,0,0; Function: 降压型; Output Current: 2A; Frequency - Switching: 1.5MHz; Synchronous Rectifier: 是; Number of Outputs: 1; Topology: 降压式; Quiescent Current: 50uA; Switch tube (built-in/external): 内置; Output Type: 可调; AddInBom: yes; ModelName: TSOT-23-5_L2.9-W1.6-H1.00-LS2.8-P0.95; LCSC Part Name: 高效1.5MHz 2A同步降压调节器; Supplier Part: C479074; Manufacturer Part: SY8089A1AAC; Supplier Footprint: SOT-23-5; JLCPCB Part Class: Extended Part; Datasheet: https://item.szlcsc.com/datasheet/SY8089A1AAC/486366.html; Supplier: LCSC; Voltage - Supply: 2.5V~5.5V; Output Voltage: -; Operating Temperature: -40℃~+125℃@(TA/TJ); Symbol: SY8089A1AAC; Device: SY8089A1AAC; ConvertToPcb: yes; FootprintName: TSOT-23-5_L2.9-W1.6-P0.95-LS2.8-BR
U5 = SY6280AAC_C55136: 类型:高侧开关;通道数:1;输入控制逻辑:高电平有效;工作电压:2.4V~5.5V;最大连续电流:2A;导通电阻:80mΩ;; Manufacturer: Silergy(矽力杰); 3D Model: 0a2a1b8f50944f73965918ad6e5fe167|0819f05c4eef4c71ace90d822a990e87; 3D Model Transform: 118.60433,114.173,0,90,0,0,0.0005,0.0005,0; Number of Channels: 1; Control Input Logic: 高电平有效; Maximum Continuous Current: 2A; RDS(on): 80mΩ; AddInBom: yes; ModelName: SOT-23-5_L2.9-W1.6-H1.1-LS2.8-P0.95; LCSC Part Name: 低损耗功率分配开关; Supplier Part: C55136; Manufacturer Part: SY6280AAC; Supplier Footprint: SOT-23-5; JLCPCB Part Class: Extended Part; Datasheet: https://item.szlcsc.com/datasheet/SY6280AAC/56162.html; Supplier: LCSC; Type: 高侧开关; Voltage - Supply: 2.4V~5.5V; Features: 短路保护；过流保护；反向电流阻断；输出放电功能；过温保护; Operating Temperature	-: -40℃~+125℃; Symbol: SY6280AAC; Device: SY6280AAC_C55136; ConvertToPcb: yes; FootprintName: SOT-23-5_L3.0-W1.7-P0.95-LS2.8-BL
U6 = ESP32-C3-WROOM-02-N4: 核心芯片:ESP32-C3芯片;频率:2.4GHz;天线形式:板载PCB天线;发射功率:20.5dBm;接收灵敏度:-105dBm;; Manufacturer: ESPRESSIF(乐鑫); Symbol: ESP32-C3-WROOM-02-N4(4MB); AddInBom: yes; ModelId: b84a3a07460a410dbd2d87addaa4e9c5|0819f05c4eef4c71ace90d822a990e87; ModelTransform: 709.4474,787.4,0,0,0,0,-0.001,122.048,0; Wireless Standard: Bluetooth5.0; Interface Type: I2S；I2C；JTAG；UART；USB；SPI; Voltage - Supply: 3V~3.6V; Receive  Current: 82mA; Send  Current: 345mA; Device: ESP32-C3-WROOM-02-N4; LCSC Part Name: 不带固件 2.4GHz Wi-Fi（802.11b/g/n）+ 蓝牙5模组; SupplierPart: C2934560; ManufacturerPart: ESP32-C3-WROOM-02-N4; Supplier Footprint: SMD,20x18mm; JLCPCB Part Class: Extended Part; Datasheet: https://item.szlcsc.com/datasheet/ESP32-C3-WROOM-02-N4/3281215.html; Supplier: LCSC; ConvertToPcb: yes; FootprintName: BULETM-SMD_ESPRESSIF_ESP32-C3-WROOM-02-N4-4MB; ModelName: BULETM-SMD_ESPRESSIF_ESP32-C3-WROOM-02-N4-4MB; Utilized IC / Part: ESP32-C3芯片; Value: 2.4GHz; Antenna Type: 板载PCB天线; Output Power: 20.5dBm; Sensitivity: -105dBm; Operating Temperature: -40℃~+85℃; Features: 集成蓝牙功能；支持USB接口
U7 = W25N01GVZEIG_C88868: 存储容量:1Gbit;时钟频率(fc):104MHz;工作电压:2.7V~3.6V;; Manufacturer: Winbond(华邦); AddInBom: yes; ModelId: 0408e8ef701a4f5fad0acb69fbbdc5af|0819f05c4eef4c71ace90d822a990e87; ModelName: WSON-8_L8.0-W6.0-H0.8-P1.27; ModelTransform: 315.7474,236.22,0,0,0,0,0.0005,0,0; Memory Size: 1Gbit; Interface: SPI; Clock Frequency: 104MHz; Page Program time (TPP): 700us; Block Erase Time(tBE): 2ms; Data Retention - TDR (Year): 10年; Standby Supply Current: 10uA; Program / Erase Cycles: 10万次; ECC: 有; Symbol: W25N01GVZEIG; Device: W25N01GVZEIG_C88868; LCSC Part Name: 具备双/四路SPI缓冲读取和连续读取功能的3V、1Gb串行SLCNAND闪存; SupplierPart: C88868; ManufacturerPart: W25N01GVZEIG; Supplier Footprint: WSON-8-EP(6x8); JLCPCB Part Class: Extended Part; Datasheet: https://item.szlcsc.com/datasheet/W25N01GVZEIG/90048.html; Supplier: LCSC; ConvertToPcb: yes; FootprintName: WSON-8_L8.0-W6.10-P1.27-TL-EP; Voltage - Supply: 2.7V~3.6V; Write Cycle Time(tWC): -; Operating Temperature: -40℃~+85℃; Features: 坏块管理功能；硬件写保护功能；读缓存功能；OTP区域写保护与锁定功能；ECC纠错功能；软件复位功能；写使能锁存；软件写保护功能
USB1 = 906-162A1011D10200: 连接器类型:Type-A;协议标准:USB 2.0;公母:母;安装方式:侧插;触点数量:4P;端口数量:1;额定电流 - 电源:2A;工作温度:-;; Manufacturer: 精拓金; 3D Model: bcfe7919af774627a59aba49c9f8feb0|0819f05c4eef4c71ace90d822a990e87; 3D Model Transform: 280.3144,555.121,0,0,0,0,0,-74.212,-118.11; Connector Type: Type-A; Protocol Standard: USB 2.0; Gender: 母; Number of Contacts: 4P; Number of Ports: 1; Current Rating-Power: 2A; Voltage Rating: 30V; Connect-Disconnect Life: 1.5千次; Symbol: AFSide of the three straight feet boundless copper14.0PBTWhite plastic90degree; AddInBom: yes; LCSC Part Name: Type-A 母 侧插; Supplier Part: C39417; Manufacturer Part: 906-162A1011D10200; Supplier Footprint: 插件; JLCPCB Part Class: Extended Part; Datasheet: https://item.szlcsc.com/datasheet/906-162A1011D10200/40400.html; Supplier: LCSC; Mounting Type: 侧插; Length: 14mm; Operating Temperature: -; Device: 906-162A1011D10200; ConvertToPcb: yes; FootprintName: USB-A-TH_4P-P1.40-V-F-C39416; ModelName: USB-A-TH_4P-P1.40-V-F-C39416
USB3 = TYPE-C 16PIN 2MD(073): 连接器类型:Type-C;协议标准:-;公母:母;安装方式:卧贴;触点数量:16P;端口数量:1;额定电流 - 电源:3A;工作温度:-25℃~+85℃;; Manufacturer: SHOU HAN(首韩); Add into BOM: yes; 3D Model: 3a41b9ec9b654a0fad4d118405ec6290; 3D Model Transform: 351.9678,298.4246,0,0,0,0,0,-47.244,-35.433; Gender: 母; Number of Contacts: 16P; Number of Ports: 1; Current Rating-Power: 3A; Voltage Rating: 5V; Connect-Disconnect Life: 1万次; Detection color: 黑色; ModelName: USB-C-SMD_TYPE-C-6PIN-2MD-073; Convert to PCB: yes; LCSC Part Name: Type-C 母 卧贴; Supplier Part: C2765186; Manufacturer Part: TYPE-C 16PIN 2MD(073); Supplier Footprint: SMD; JLCPCB Part Class: Extended Part; Datasheet: https://item.szlcsc.com/datasheet/TYPE-C%252016PIN%25202MD(073)/2901843.html; Supplier: LCSC; Connector Type: Type-C; Protocol Standard: -; Mounting Type: 卧贴; Supplementary Features: -; Center Height: -; Length: -; Operating Temperature: -25℃~+85℃; Symbol: TYPE-C 16PIN 2MD(073); Device: TYPE-C 16PIN 2MD(073); FootprintName: USB-C-SMD_TYPE-C-16PIN-2MD-073
X1 = XL2EL89COI-111YLC-24M: 晶振类型:贴片晶振;频率:24MHz;常温频差:±10ppm;负载电容:12pF;频率稳定度:±20ppm;; Manufacturer: YXC(扬兴晶振); 3D Model: ff2dfd5650294453a14147960efe1838|0819f05c4eef4c71ace90d822a990e87; 3D Model Transform: 125.984,98.425,0,0,0,0,0,0,0; Normal temperature Frequency Tolerance: ±10ppm; Load Capacitance: 12pF; Frequency Stability: ±20ppm; AddInBom: yes; LCSC Part Name: YSX321SL 24MHZ 4P 3225 12PF ±10PPM -40~85℃ (±20PPM); Supplier Part: C5444545; Manufacturer Part: XL2EL89COI-111YLC-24M; Supplier Footprint: SMD3225-4P; JLCPCB Part Class: Extended Part; Datasheet: https://item.szlcsc.com/datasheet/XL2EL89COI-111YLC-24M/6336541.html; Supplier: LCSC; Type: 贴片晶振; Value: 24MHz; Operating Temperature: -40℃~+85℃; Symbol: XL2EL89COI-111YLC-24M; Device: XL2EL89COI-111YLC-24M; ConvertToPcb: yes; FootprintName: CRYSTAL-SMD_4P-L3.2-W2.5-BL; ModelName: CRYSTAL-SMD_4P-L3.2-W2.5-BL